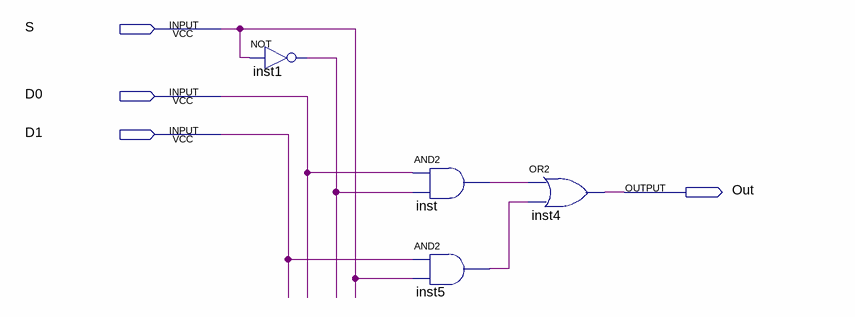
[diagram p0: schematic sheet]
// Quartus schematic TwoOneMux.bdf as structural Verilog: 4 symbols, 4 pins
module TwoOneMux (
  input  S,
  input  D0,
  input  D1,
  output Out
);

  wire inst1_out, inst5_out, inst_out;

  not inst1 (inst1_out, S);
  and inst (inst_out, D0, inst1_out);
  and inst5 (inst5_out, D1, S);
  or inst4 (Out, inst_out, inst5_out);
endmodule
